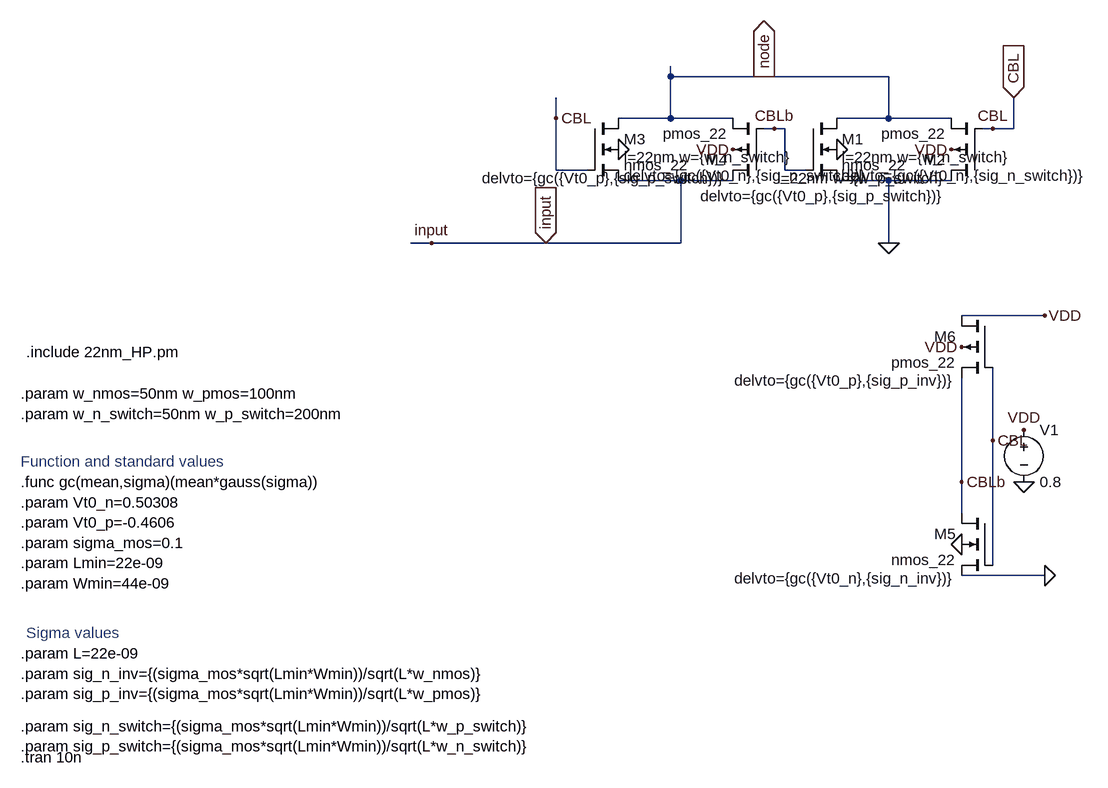
[diagram p0: schematic transmissiongate_switch.asc]
transmissiongate_switch.asc, the LTspice schematic file:
Version 4.1
SHEET 1 888 868
WIRE 128 -240 128 -256
WIRE 272 -240 128 -240
WIRE 464 -240 272 -240
WIRE -48 -176 -48 -208
WIRE 128 -176 128 -240
WIRE 128 -176 48 -176
WIRE 224 -176 128 -176
WIRE 464 -176 464 -240
WIRE 464 -176 384 -176
WIRE 560 -176 464 -176
WIRE 288 -160 272 -160
WIRE 304 -160 288 -160
WIRE 624 -160 608 -160
WIRE 656 -160 656 -208
WIRE 656 -160 624 -160
WIRE -48 -96 -48 -176
WIRE 0 -96 -48 -96
WIRE 304 -96 304 -160
WIRE 336 -96 304 -96
WIRE 144 -80 48 -80
WIRE 224 -80 144 -80
WIRE 464 -80 384 -80
WIRE 560 -80 464 -80
WIRE -240 16 -272 16
WIRE -64 16 -240 16
WIRE 144 16 144 -80
WIRE 144 16 -64 16
WIRE 464 16 464 -80
WIRE 704 128 576 128
WIRE 624 320 624 208
WIRE 576 384 576 224
WIRE 576 432 576 384
WIRE 624 512 624 320
WIRE 704 528 576 528
FLAG 384 -128 0
FLAG 560 -128 VDD
FLAG 48 -128 0
FLAG 224 -128 VDD
FLAG 464 16 0
FLAG -240 16 input
FLAG 704 128 VDD
FLAG 576 176 VDD
FLAG 576 480 0
FLAG 704 528 0
FLAG 656 -208 CBL
IOPIN 656 -208 In
FLAG 624 -160 CBL
FLAG 624 320 CBL
FLAG -48 -176 CBL
FLAG 576 384 CBLb
FLAG 288 -160 CBLb
FLAG -64 16 input
IOPIN -64 16 In
FLAG 272 -240 node
IOPIN 272 -240 Out
FLAG 672 384 0
FLAG 672 304 VDD
SYMBOL nmos4 336 -176 R0
WINDOW 123 56 60 Left 2
WINDOW 39 56 88 Left 2
SYMATTR Value2 l=22nm w={w_n_switch}
SYMATTR SpiceLine delvto={gc({Vt0_n},{sig_n_switch})}
SYMATTR InstName M1
SYMATTR Value nmos_22
SYMBOL pmos4 608 -80 R180
WINDOW 123 56 4 Left 2
WINDOW 39 56 -24 Left 2
SYMATTR Value2 l=22nm w={w_p_switch}
SYMATTR SpiceLine delvto={gc({Vt0_p},{sig_p_switch})}
SYMATTR InstName M2
SYMATTR Value pmos_22
SYMBOL nmos4 0 -176 R0
WINDOW 123 56 60 Left 2
WINDOW 39 56 88 Left 2
SYMATTR Value2 l=22nm w={w_n_switch}
SYMATTR SpiceLine delvto={gc({Vt0_n},{sig_n_switch})}
SYMATTR InstName M3
SYMATTR Value nmos_22
SYMBOL pmos4 272 -80 R180
WINDOW 39 56 4 Left 2
SYMATTR SpiceLine delvto={gc({Vt0_p},{sig_p_switch})}
SYMATTR InstName M4
SYMATTR Value pmos_22
SYMATTR Value2 l=22nm w={w_p_switch}
SYMBOL nmos4 624 432 M0
WINDOW 39 56 100 Left 2
SYMATTR SpiceLine delvto={gc({Vt0_n},{sig_n_inv})}
SYMATTR InstName M5
SYMATTR Value nmos_22
SYMATTR Value2 l=22nm w={w_nmos}
SYMBOL pmos4 624 128 M0
WINDOW 39 56 100 Left 2
SYMATTR SpiceLine delvto={gc({Vt0_p},{sig_p_inv})}
SYMATTR InstName M6
SYMATTR Value pmos_22
SYMATTR Value2 l=22nm w={w_pmos}
SYMBOL voltage 672 288 R0
WINDOW 123 0 0 Left 0
WINDOW 39 0 0 Left 0
SYMATTR InstName V1
SYMATTR Value 0.8
TEXT -872 248 Left 2 !.param w_nmos=50nm w_pmos=100nm\n.param w_n_switch=50nm w_p_switch=200nm
TEXT -872 384 Left 2 !.func gc(mean,sigma)(mean*gauss(sigma))\n.param Vt0_n=0.50308\n.param Vt0_p=-0.4606\n.param sigma_mos=0.1\n.param Lmin=22e-09\n.param Wmin=44e-09
TEXT -872 648 Left 2 !.param L=22e-09\n.param sig_n_inv={(sigma_mos*sqrt(Lmin*Wmin))/sqrt(L*w_nmos)}\n.param sig_p_inv={(sigma_mos*sqrt(Lmin*Wmin))/sqrt(L*w_pmos)}
TEXT -872 352 Left 2 ;Function and standard values
TEXT -864 616 Left 2 ;Sigma values
TEXT -872 760 Left 2 !.param sig_n_switch={(sigma_mos*sqrt(Lmin*Wmin))/sqrt(L*w_p_switch)}\n.param sig_p_switch={(sigma_mos*sqrt(Lmin*Wmin))/sqrt(L*w_n_switch)}
TEXT -872 808 Left 2 !.tran 10n
TEXT -864 184 Left 2 !.include 22nm_HP.pm

The netlist it stands for:
* transmissiongate_switch.asc
M1 node CBLb 0 0 nmos_22 l=22nm w={w_n_switch} delvto={gc({Vt0_n},{sig_n_switch})}
M2 0 CBL node VDD pmos_22 l=22nm w={w_p_switch} delvto={gc({Vt0_p},{sig_p_switch})}
M3 node CBL input 0 nmos_22 l=22nm w={w_n_switch} delvto={gc({Vt0_n},{sig_n_switch})}
M4 input CBLb node VDD pmos_22 l=22nm w={w_p_switch} delvto={gc({Vt0_p},{sig_p_switch})}
M5 CBLb CBL 0 0 nmos_22 l=22nm w={w_nmos} delvto={gc({Vt0_n},{sig_n_inv})}
M6 VDD CBL CBLb VDD pmos_22 l=22nm w={w_pmos} delvto={gc({Vt0_p},{sig_p_inv})}
V1 VDD 0 0.8
.model NMOS NMOS
.model PMOS PMOS
.lib standard.mos
.param w_nmos=50nm w_pmos=100nm
.param w_n_switch=50nm w_p_switch=200nm
.func gc(mean,sigma)(mean*gauss(sigma))
.param Vt0_n=0.50308
.param Vt0_p=-0.4606
.param sigma_mos=0.1
.param Lmin=22e-09
.param Wmin=44e-09
.param L=22e-09
.param sig_n_inv={(sigma_mos*sqrt(Lmin*Wmin))/sqrt(L*w_nmos)}
.param sig_p_inv={(sigma_mos*sqrt(Lmin*Wmin))/sqrt(L*w_pmos)}
* Function and standard values
* Sigma values
.param sig_n_switch={(sigma_mos*sqrt(Lmin*Wmin))/sqrt(L*w_p_switch)}
.param sig_p_switch={(sigma_mos*sqrt(Lmin*Wmin))/sqrt(L*w_n_switch)}
.tran 10n
.include 22nm_HP.pm
.backanno
.end